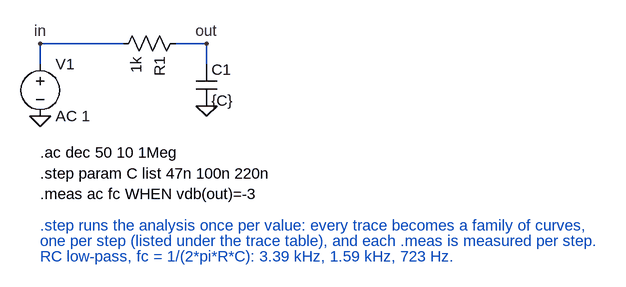
[diagram p0: schematic step_rc.asc]
step_rc.asc, the LTspice schematic file:
Version 4
SHEET 1 880 680
WIRE -32 64 96 64
WIRE 224 64 176 64
WIRE 224 96 224 64
WIRE -32 96 -32 64
FLAG -32 176 0
FLAG 224 160 0
FLAG 224 64 out
FLAG -32 64 in
SYMBOL voltage -32 80 R0
SYMATTR InstName V1
SYMATTR Value AC 1
SYMBOL res 192 48 R90
SYMATTR InstName R1
SYMATTR Value 1k
SYMBOL cap 208 96 R0
SYMATTR InstName C1
SYMATTR Value {C}
TEXT -32 232 Left 2 !.ac dec 50 10 1Meg
TEXT -32 264 Left 2 !.step param C list 47n 100n 220n
TEXT -32 296 Left 2 !.meas ac fc WHEN vdb(out)=-3
TEXT -32 344 Left 2 ;.step runs the analysis once per value: every trace becomes a family of curves,
TEXT -32 368 Left 2 ;one per step (listed under the trace table), and each .meas is measured per step.
TEXT -32 392 Left 2 ;RC low-pass, fc = 1/(2*pi*R*C): 3.39 kHz, 1.59 kHz, 723 Hz.

The netlist it stands for:
* step_rc.asc
V1 in 0 AC 1
R1 out in 1k
C1 out 0 {C}
.ac dec 50 10 1Meg
.step param C list 47n 100n 220n
.meas ac fc WHEN vdb(out)=-3
* .step runs the analysis once per value: every trace becomes a family of curves,
* one per step (listed under the trace table), and each .meas is measured per step.
* RC low-pass, fc = 1/(2*pi*R*C): 3.39 kHz, 1.59 kHz, 723 Hz.
.backanno
.end